# EasyEDA Pro project ProDoc_Integrated Board_2026-04-06FINAL.epro, board IC Mounted board
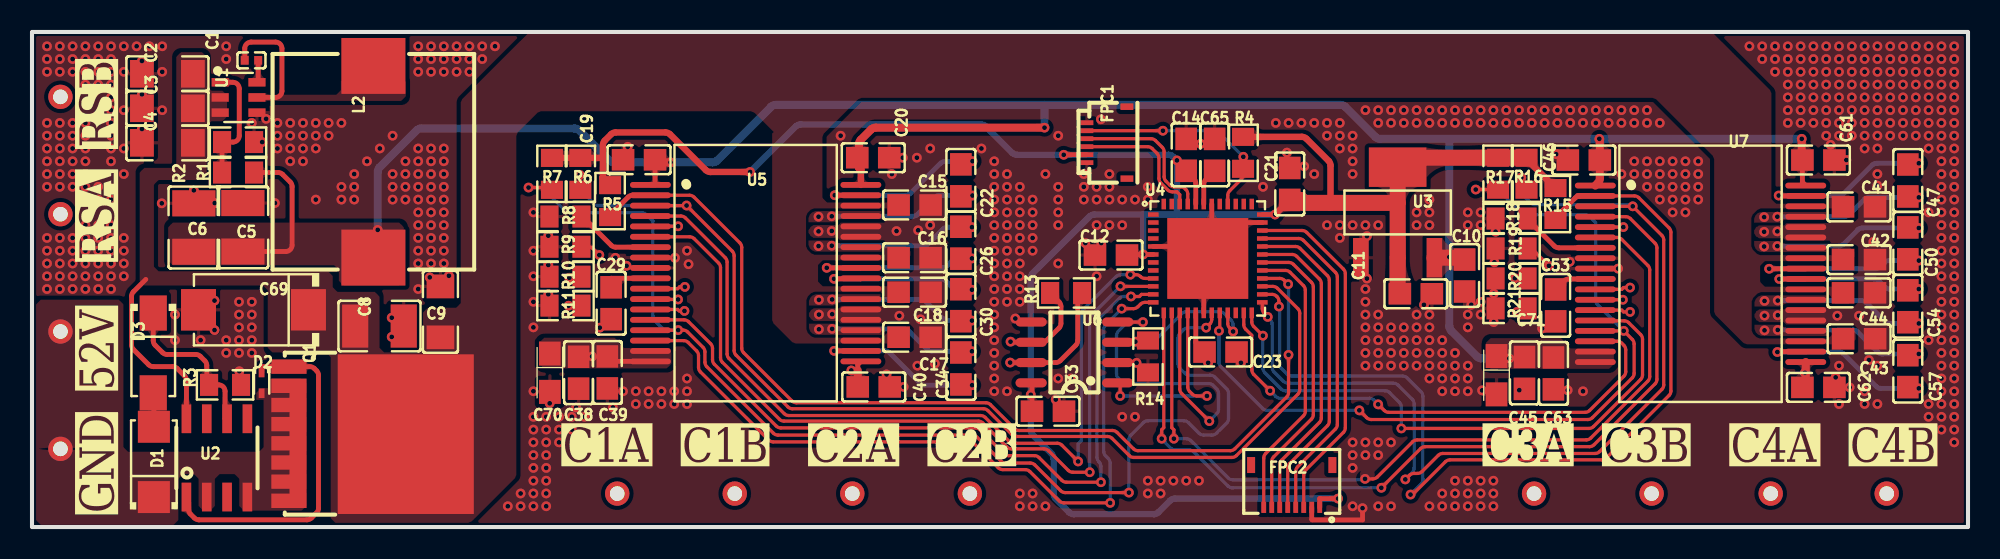
[diagram p1: board, top side]
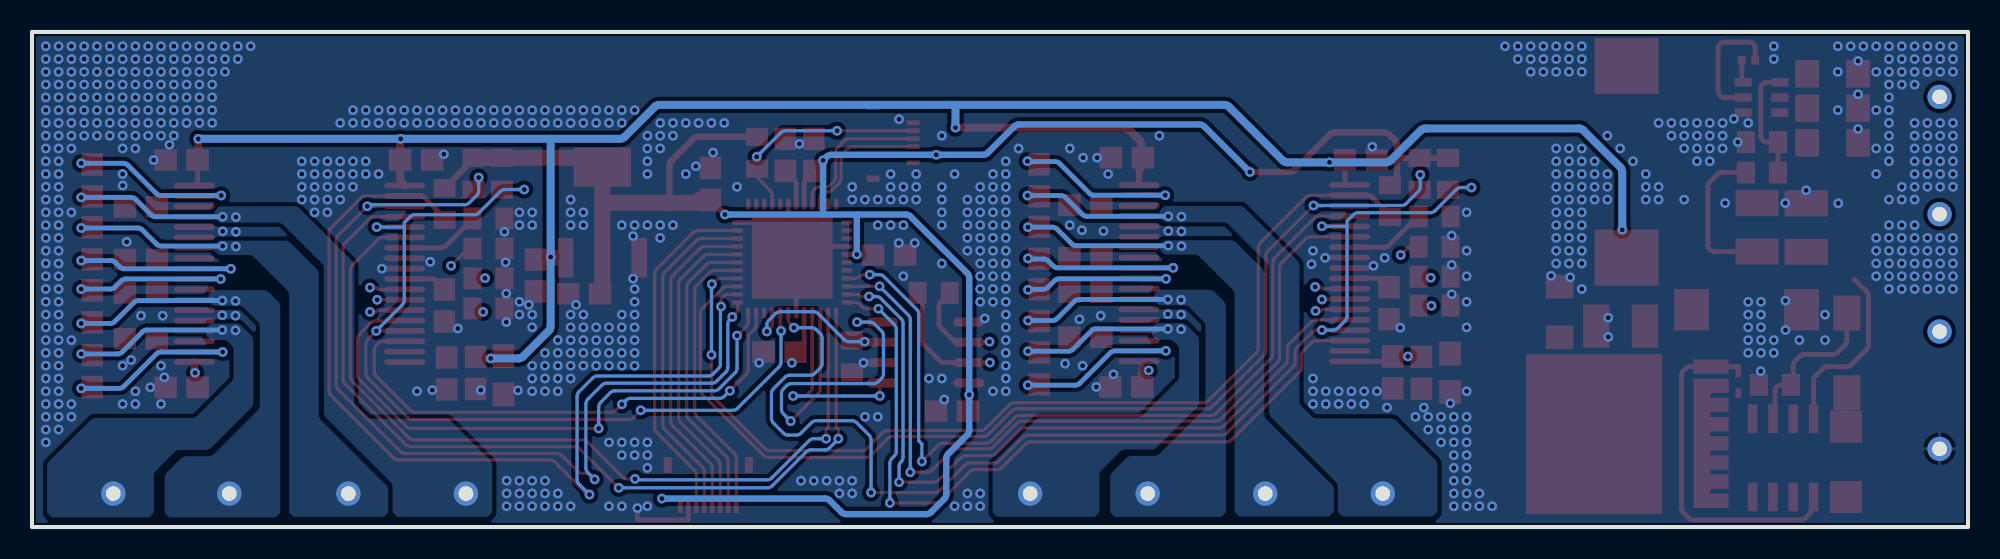
[diagram p2: board, bottom side, seen from below]

Outline 121 x 31 mm; copper layers: Top Layer, GND1, PWR (20VB/12VB), Bottom Layer. Coordinates in mm from the lower left corner of the outline.
Outline path: rectangle 0,31 121,0
Stack: Top Layer 0.035mm Outer layer thickness 1oz / Dielectric1 0.2104mm 7628 RC49% 8.6mil / GND1 0.0152mm Inner layer thickness / Dielectric2 1.065mm 1.1mm H/HOZ Copper / PWR (20VB/12VB) 0.0152mm Inner layer thickness / Dielectric3 0.2104mm 7628 RC49% 8.6mil / Bottom Layer 0.035mm Outer layer thickness 1oz

## Design rules (mm)
template: Custom Config
spacing copperThickness1oz (default): track to track 0.102, other pairs 0.152 to 0.3
spacing copperThickness2oz: track to track 0.203, other pairs 0.152 to 0.3
track width copperThickness1oz (default): min 0.203, default 0.203, max 2.54
track width copperThickness2oz: min 0.203, default 0.203, max 2.54
differential pair differentialPair (default): width min 0.127, default 0.254, max 2.54; gap min 0.152, default 0.152
via viaSize (default): diameter min 0.5, default 0.61, max 10; hole min 0.3, default 0.305, max 6.3

## Placement (name value [footprint] x y rotation side)
C1  100nF  [C0402]  13.72 29.22 180 top
C2  1uF  [C1206]  8.46 28.38 0 top
C3  1uF  [C1206]  8.46 26.22 0 top
C4  1uF  [C1206]  8.46 24.06 0 top
C5  10uF  [C1210]  13.18 18.77 270 top
C6  10uF  [C1210]  10.12 18.75 270 top
C8  4.7uF  [C1210]  21.72 12.58 180 top
C9  100nF  [C1206]  25.53 13.47 270 top
C10  10uF  [C0805]  89.54 15.75 90 top
C11  10uF  [C0805]  86.49 14.61 180 top
C12  100nF  [C0805]  67.44 17.03 0 top
C14  100nF  [C0805]  72.14 23.3 270 top
C15  100nF  [C0805]  55.16 20.17 180 top
C16  100nF  [C0805]  55.16 16.86 180 top
C17  100nF  [C0805]  55.16 11.89 180 top
C18  100nF  [C0805]  55.16 14.7 180 top
C19  100nF  [C0805]  37.94 23 0 top
C20  100nF  [C0805]  52.58 23.13 180 top
C21  100nF  [C0805]  78.61 21.48 270 top
C22  100nF  [C0805]  58.06 21.71 90 top
C23  100nF  [C0805]  74.28 10.96 180 top
C26  100nF  [C0805]  58.06 17.8 90 top
C29  100nF  [C0805]  36.2 14.01 270 top
C30  100nF  [C0805]  58.06 13.89 90 top
C33  100nF  [C0805]  63.5 7.25 180 top
C34  100nF  [C0805]  58.06 9.93 90 top
C38  100nF  [C0805]  34.16 9.66 90 top
C39  100nF  [C0805]  35.96 9.68 90 top
C40  100nF  [C0805]  52.61 8.77 180 top
C41  100nF  [C0805]  114.19 20.05 180 top
C42  100nF  [C0805]  114.19 16.75 180 top
C43  100nF  [C0805]  114.19 11.79 180 top
C44  100nF  [C0805]  114.19 14.66 180 top
C45  100nF  [C0805]  93.28 9.65 90 top
C46  100nF  [C0805]  96.99 22.98 0 top
C47  100nF  [C0805]  117.24 21.7 90 top
C50  100nF  [C0805]  117.24 17.76 90 top
C53  100nF  [C0805]  95.23 13.88 270 top
C54  100nF  [C0805]  117.24 13.83 90 top
C57  100nF  [C0805]  117.24 9.76 90 top
C61  100nF  [C0805]  111.65 22.98 180 top
C62  100nF  [C0805]  111.65 8.75 180 top
C63  100nF  [C0805]  95.09 9.62 90 top
C65  1uF  [C0805]  73.91 23.3 270 top
C69  22uF  [CAP-SMD_L7.3-W4.3-FD]  13.84 13.6 180 top
C70  4.7uF  [CASE-A_3216]  32.37 9.66 270 top
C71  4.7uF  [CASE-A_3216]  91.53 9.51 270 top
D1  SMAT70A-13-F  [SMA_L4.3-W2.6-LS5.2-RD]  7.62 4.08 90 top
D2  DDZ9699T-7  [SOD-523_L1.2-W0.8-LS1.6-RD]  14.35 9.03 270 top
D3  SMAJ24A  [SMA-SMD_L4.4-W2.7-LS5.4-RD]  7.58 10.9 270 top
FPC1  HC-FPC-05-09-6RLTAG  [FPC-SMD_6P-P0.50_HC-FPC-05-09-6RLTAG]  67.18 24.07 270 top
FPC2  5034800800  [FPC-SMD_5034800800]  78.73 2.56 180 top
L2  22uH  [IND-SMD_L13.5-W12.6]  21.34 22.87 270 top
NOREF  -  [Pad_e15]  1.78 4.9 0 top
NOREF#2  -  [Pad_e12]  1.78 26.94 0 top
NOREF#3  -  [Pad_e24]  93.88 2.09 90 top
NOREF#4  -  [Pad_e27]  115.92 2.09 90 top
NOREF#5  -  [Pad_e13]  1.78 19.59 0 top
NOREF#6  -  [Pad_e14]  1.78 12.24 0 top
NOREF#7  -  [Pad_e23]  58.62 2.09 90 top
NOREF#8  -  [Pad_e26]  108.67 2.09 90 top
NOREF#9  -  [Pad_e25]  101.23 2.09 90 top
NOREF#10  -  [Pad_e20]  36.58 2.09 90 top
NOREF#11  -  [Pad_e22]  51.27 2.09 90 top
NOREF#12  -  [Pad_e21]  43.92 2.09 90 top
Q1  XRS200N15TL  [TOLL-8_L10.4-W9.9-P1.20-LS11.7-BL_2]  19.71 7.64 270 top
R1  100kΩ  [R0805]  12.88 22.2 0 top
R2  7.15kΩ  [R0805]  12.88 24.1 180 top
R3  1kΩ  [R0805]  12.07 8.9 0 top
R4  10kΩ  [R0805]  75.69 23.43 90 top
R5  10kΩ  [R0805]  36.13 20.41 270 top
R6  10kΩ  [R0805]  34.27 22.11 270 top
R7  10kΩ  [R0805]  32.5 22.11 270 top
R8  24kΩ  [R0805]  33.34 19.44 0 top
R9  10kΩ  [R0805]  33.34 17.55 0 top
R10  10kΩ  [R0805]  33.34 15.68 0 top
R11  10kΩ  [R0805]  33.34 13.87 0 top
R13  120Ω  [R0805]  64.63 14.66 0 top
R14  10kΩ  [R0805]  69.75 10.68 90 top
R15  10kΩ  [R0805]  95.22 20.23 270 top
R16  10kΩ  [R0805]  93.41 22.12 270 top
R17  10kΩ  [R0805]  91.63 22.12 270 top
R18  24kΩ  [R0805]  92.47 19.32 0 top
R19  10kΩ  [R0805]  92.47 17.44 0 top
R20  10kΩ  [R0805]  92.47 15.57 0 top
R21  10kΩ  [R0805]  92.47 13.69 0 top
U1  LMR51625YDDCR  [SOT-23-6_L2.9-W1.6-P0.95-LS2.8-BL]  12.91 26.9 270 top
U2  LTC4359HS8#PBF  [SO-8_L4.9-W3.9-P1.27-LS6.0-BL]  11.56 4.33 0 top
U3  LD1117AG-33-AA3-A-R  [SOT-223-4_L6.5-W3.5-P2.30-LS7.0-BR]  85.35 19.7 270 top
U4  ATSAMD21G18A-MU  [QFN-48_L7.0-W7.0-P0.50-TL-EP5.1]  73.49 16.82 0 top
U5  DRV8432DKDR  [HSSOP-36_L16.0-W11.0-P0.65-LS14.2-BL]  45.23 15.9 270 top
U6  SP3485EN-L/TR  [SOIC-8_L5.0-W4.0-P1.27-LS6.0-BL]  65.15 10.93 90 top
U7  DRV8432DKDR  [HSSOP-36_L16.0-W11.0-P0.65-LS14.2-BL]  104.28 15.86 270 top

## Footprints (pads in the part's own frame, mm; a bottom-side part is the same pattern mirrored in y, then rotated)
C0402
  rect 0.5x0.54 smd: 1(-0.42,0) 2(0.42,0)
C0805
  rect 1.41x1.35 smd: 1(-1,0) 2(1,0)
C1206
  rect 1.485x1.728 smd: 1(-1.593,0) 2(1.593,0)
C1210
  rect 1.635x2.7 smd: 1(-1.518,0) 2(1.518,0)
CAP-SMD_L7.3-W4.3-FD
  rect 2.185x2.592 smd: 1(-3.437,0) 2(3.437,0)
CASE-A_3216
  rect 1.5x1.359 smd: 1(-1.2,0) 2(1.2,0)
FPC-SMD_6P-P0.50_HC-FPC-05-09-6RLTAG
  rect 0.3x0.8 smd: 1(1.25,-1.25) 2(0.75,-1.25) 3(0.25,-1.25) 4(-0.25,-1.25) 5(-0.75,-1.25) 6(-1.25,-1.25)
  rect 0.4x0.8 smd: 7(-2.25,1.25) 8(2.25,1.25)
FPC-SMD_5034800800
  rect 0.3x0.7 smd: 1(-1.75,1.325) 2(-1.25,1.325) 3(-0.75,1.325) 4(-0.25,1.325) 5(0.25,1.325) 6(0.75,1.325) 7(1.25,1.325) 8(1.75,1.325)
  rect 0.5x1 smd: 9(2.54,-1.325) 10(-2.54,-1.325)
HSSOP-36_L16.0-W11.0-P0.65-LS14.2-BL
  oval 0.364x2.552 smd: 1(-5.525,-6.576) 2(-4.875,-6.576) 3(-4.225,-6.576) 4(-3.575,-6.576) 5(-2.925,-6.576) 6(-2.275,-6.576) 7(-1.625,-6.576) 8(-0.975,-6.576) 9(-0.325,-6.576) 10(0.325,-6.576) 11(0.975,-6.576) 12(1.625,-6.576) 13(2.275,-6.576) 14(2.925,-6.576) 15(3.575,-6.576) 16(4.225,-6.576) 17(4.875,-6.576) 18(5.525,-6.576) 19(5.525,6.576) 20(4.875,6.576) 21(4.225,6.576) 22(3.575,6.576) 23(2.925,6.576) 24(2.275,6.576) 25(1.625,6.576) 26(0.975,6.576) 27(0.325,6.576) 28(-0.325,6.576) 29(-0.975,6.576) 30(-1.625,6.576) 31(-2.275,6.576) 32(-2.925,6.576) 33(-3.575,6.576) 34(-4.225,6.576) 35(-4.875,6.576) 36(-5.525,6.576)
IND-SMD_L13.5-W12.6
  rect 3.5x4 smd: 1(-6,0) 2(6,0)
Pad_e12
  round 1.524 hole 0.914: 1(0,0)
Pad_e13
  round 1.524 hole 0.914: 2(0,0)
Pad_e14
  round 1.524 hole 0.914: 3(0,0)
Pad_e15
  round 1.524 hole 0.914: 4(0,0)
Pad_e20
  round 1.524 hole 0.914: 1(0,0)
Pad_e21
  round 1.524 hole 0.914: 2(0,0)
Pad_e22
  round 1.524 hole 0.914: 3(0,0)
Pad_e23
  round 1.524 hole 0.914: 4(0,0)
Pad_e24
  round 1.524 hole 0.914: 1(0,0)
Pad_e25
  round 1.524 hole 0.914: 2(0,0)
Pad_e26
  round 1.524 hole 0.914: 3(0,0)
Pad_e27
  round 1.524 hole 0.914: 4(0,0)
QFN-48_L7.0-W7.0-P0.50-TL-EP5.1
  rect 0.665x0.28 smd: 1(-3.408,2.75) 2(-3.408,2.25) 3(-3.408,1.75) 4(-3.408,1.25) 5(-3.408,0.75) 6(-3.408,0.25) 7(-3.408,-0.25) 8(-3.408,-0.75) 9(-3.408,-1.25) 10(-3.408,-1.75) 11(-3.408,-2.25) 12(-3.408,-2.75) 25(3.408,-2.75) 26(3.408,-2.25) 27(3.408,-1.75) 28(3.408,-1.25) 29(3.408,-0.75) 30(3.408,-0.25) 31(3.408,0.25) 32(3.408,0.75) 33(3.408,1.25) 34(3.408,1.75) 35(3.408,2.25) 36(3.408,2.75)
  rect 0.28x0.665 smd: 13(-2.75,-3.408) 14(-2.25,-3.408) 15(-1.75,-3.408) 16(-1.25,-3.408) 17(-0.75,-3.408) 18(-0.25,-3.408) 19(0.25,-3.408) 20(0.75,-3.408) 21(1.25,-3.408) 22(1.75,-3.408) 23(2.25,-3.408) 24(2.75,-3.408) 37(2.75,3.408) 38(2.25,3.408) 39(1.75,3.408) 40(1.25,3.408) 41(0.75,3.408) 42(0.25,3.408) 43(-0.25,3.408) 44(-0.75,3.408) 45(-1.25,3.408) 46(-1.75,3.408) 47(-2.25,3.408) 48(-2.75,3.408)
  rect 5.06x5.06 smd: 49(0,0)
R0805
  rect 1.133x1.377 smd: 1(-1,0) 2(1,0)
SMA-SMD_L4.4-W2.7-LS5.4-RD
  rect 2.2x1.7 smd: 1(-2.5,0) 2(2.5,0)
SMA_L4.3-W2.6-LS5.2-RD
  rect 2x2 smd: 1(-2.2,0) 2(2.2,0)
SO-8_L4.9-W3.9-P1.27-LS6.0-BL
  rect 0.6x1.8 smd: 1(-1.905,-2.45) 2(-0.635,-2.45) 3(0.635,-2.45) 4(1.905,-2.45) 5(1.905,2.45) 6(0.635,2.45) 7(-0.635,2.45) 8(-1.905,2.45)
SOD-523_L1.2-W0.8-LS1.6-RD
  rect 0.6x0.36 smd: 1(-0.65,0) 2(0.65,0)
SOIC-8_L5.0-W4.0-P1.27-LS6.0-BL
  oval 0.569x1.95 smd: 1(-1.905,-2.705) 2(-0.635,-2.705) 3(0.635,-2.705) 4(1.905,-2.705) 5(1.905,2.705) 6(0.635,2.705) 7(-0.635,2.705) 8(-1.905,2.705)
SOT-23-6_L2.9-W1.6-P0.95-LS2.8-BL
  rect 0.532x1.072 smd: 1(-0.95,-1.149) 2(0,-1.149) 3(0.95,-1.149) 4(0.95,1.149) 5(0,1.149) 6(-0.95,1.149)
SOT-223-4_L6.5-W3.5-P2.30-LS7.0-BR
  rect 2.47x0.98 smd: 1(2.835,-2.3) 2(2.835,0) 3(2.835,2.3)
  rect 2.47x3.6 smd: 4(-2.835,0)
TOLL-8_L10.4-W9.9-P1.20-LS11.7-BL_2
  rect 0.9x2.2 smd: 1(-2.4,-3.65)
  custom 8.1x2.2 smd: 2(2.4,-3.65)
  rect 10x8.5 smd: 3(1.825,3.65)

## Nets
As in the schematic, except:
+52V: D1.1 D2.2 NOREF#6.3 Q1.2 U2.2 U2.4
GND: C2.1 C3.1 C4.1 C5.1 C6.1 C8.1 C9.1 C10.1 C11.1 C12.1 C14.1 C15.1 C16.1 C17.1 C18.1 C19.1 C20.1 C21.1 C23.1 C29.2 C33.1 C38.1 C39.1 C40.1 C41.1 C42.1 C43.1 C44.1 C45.1 C46.1 C53.2 C61.1 C62.1 C63.1 C65.1 C69.2 C70.2 C71.2 FPC1.1 FPC1.6 FPC2.2 NOREF.4 R2.1 R3.2 R8.1 R9.1 R10.1 R11.1 R14.1 R18.1 R19.1 R20.1 R21.1 U1.4 U3.1 U4.5 U4.18 U4.35 U4.42 U4.49 U5.8 U5.9 U5.23 U5.24 U5.31 U5.32 U6.2 U6.5 U7.8 U7.9 U7.23 U7.24 U7.31 U7.32
COIL1_A: C22.1 NOREF#10.1 U5.33
COIL1_B: C26.2 NOREF#12.2 U5.30
COIL2_A: C30.1 NOREF#11.3 U5.25
COIL2_B: C34.2 NOREF#7.4 U5.22
COIL3_A: C47.1 NOREF#3.1 U7.33
COIL3_B: C50.2 NOREF#9.2 U7.30
COIL4_A: C54.1 NOREF#8.3 U7.25
COIL4_B: C57.2 NOREF#4.4 U7.22
RS485_A: NOREF#5.2 R13.1 U6.6
RS485_B: NOREF#2.1 R13.2 U6.7

Pads without a net: FPC1 7 8; FPC2 9 10; U2 3 5 7; U4 1 2 3 4 7 8 22 37 38 39 41 47 48

## Via types
v1: diameter 0.61, hole 0.305, Top Layer to Bottom Layer, 883 vias

## Routing (per net, layer and track width the routed paths; a pad name or vN(x,y) marks a point on that pad's centre or on a via; arc(x,y) is an arc through that point)
+3V3B: length 163.8
  Top Layer w0.3: v1(81.63,1.78) 80.48,1.78 80.48,1.23 ; U4.17 72.74,11.67 arc(72.77,11.52) 72.85,11.39 C23.2 ; v1(64.48,23.31) 64.49,23.32 FPC1.2 ; 62.45,9.03 62.5,8.97 C33.2 ; C14.2 72.62,21.82 arc(72.71,21.69) 72.74,21.54 U4.44 ; U4.36 77.53,19.57 arc(77.68,19.6) 77.81,19.68 ; U4.6 v1(69.45,17.07) 68.47,17.07 C12.2
  Top Layer w0.305: 35.87,21.66 36.2,21.33
  Top Layer w0.4: R7.1 R6.1 35.68,23.11 ; R4.2 79.37,24.43 arc(79.52,24.4) 79.65,24.31 81.04,22.92 arc(81.13,22.8) 81.16,22.64 81.16,20.3 ; R15.1 93.11,23.33 ; 35.68,23.11 35.68,21.84 35.87,21.66 ; 35.68,23.11 35.68,23.92 arc(35.71,24.07) 35.8,24.2 36.19,24.59 arc(36.32,24.68) 36.47,24.71 39.59,24.71 arc(39.75,24.68) 39.88,24.59 42.12,22.35 arc(42.25,22.26) 42.4,22.23 v1(44.88,22.23) ; 77.81,19.68 78.49,20.37 arc(78.62,20.45) 78.77,20.48
  Top Layer w1: 78.77,20.48 79.28,20.48 79.47,20.3 85.35,20.3 ; C11.2 85.35,14.74 U3.2 85.35,20.3 ; 85.35,20.3 85.35,22.72 arc(85.47,23.01) 85.75,23.12 R17.1 92.91,23.12
  PWR (20VB/12VB) w0.4: v1(81.63,1.78) 76.82,1.78 arc(76.67,1.81) 76.54,1.9 75.23,3.22 arc(75.14,3.35) 75.11,3.5 75.11,8.52 arc(75.08,8.67) 74.99,8.8 v1(73.51,10.28)
  Bottom Layer w0.4: 69.45,19.57 71.56,19.57 ; 69.45,19.57 66.38,19.57 arc(66.23,19.54) 66.1,19.45 62.54,15.89 arc(62.45,15.76) 62.42,15.61 v1(62.42,8.28) 62.42,6.06 arc(62.45,5.91) 62.54,5.78 63.74,4.58 arc(63.83,4.45) 63.86,4.29 63.86,2.05 arc(63.89,1.9) 63.98,1.77 64.82,0.92 arc(64.95,0.84) 65.1,0.81 70.12,0.81 arc(70.27,0.84) 70.4,0.92 71.14,1.67 arc(71.27,1.75) 71.42,1.78 v1(81.63,1.78) ; 69.45,19.57 v1(69.45,17.07) ; 71.56,19.57 71.56,22.79 arc(71.53,22.95) 71.44,23.08 71.33,23.19 arc(71.2,23.28) 71.04,23.31 v1(64.48,23.31) 61.55,23.31 arc(61.4,23.34) 61.27,23.42 59.6,25.09 arc(59.47,25.18) 59.32,25.21 48.02,25.21 arc(47.87,25.18) 47.74,25.09 v1(44.88,22.23) ; 71.56,19.57 v1(77.69,19.57)
  vias: v1(71.56,22.96)
+12VB: length 206.6
  Top Layer w0.305: 13.18,17.25 15.86,17.25 arc(16.14,17.37) 16.26,17.65 16.26,21.32 arc(16.23,21.47) 16.14,21.6 15.66,22.08 arc(15.53,22.17) 15.38,22.2 R1.2 ; C61.2 110.65,21.59 U7.36 ; v1(51.21,9.81) 51.61,9.81 51.61,10.18 51.8,10.37 ; U5.1 38.94,21.42 C19.2 ; C39.2 36.15,10.49 arc(36.28,10.4) 36.43,10.37 U5.18
  Top Layer w0.4: 51.68,23.02 C20.2 ; 51.8,22.39 51.8,21.42
  Top Layer w0.5: v1(63.28,25.01) 52.72,25.01 arc(52.57,24.98) 52.44,24.89 51.8,24.25 arc(51.71,24.12) 51.68,23.97 51.68,22.51 51.8,22.39 ; v1(110.61,24.31) 110.61,23.02 C61.2 ; U7.19 110.86,8.96 C62.2 ; C40.2 51.61,9.81 ; C19.2 39.11,22.83 v1(39.91,22.83) ; U7.1 97.87,21.55 arc(97.96,21.68) 97.99,21.83 C46.2 97.99,24.28 v1(97.96,24.31)
  Top Layer w1: U3.3 89.43,16.86 C10.2
  PWR (20VB/12VB) w0.5: v1(110.81,9.66) 110.81,24.11 v1(110.61,24.31) ; v1(51.21,9.81) 44.38,9.81 arc(44.22,9.84) 44.09,9.92 43.45,10.57 arc(43.32,10.65) 43.17,10.68 v1(35.01,10.68) 26.52,10.68 arc(26.37,10.71) 26.24,10.8 21.73,15.32 arc(21.64,15.45) 21.61,15.6 v1(21.61,18.61)
  Bottom Layer w0.5: 63.28,26.43 81.79,26.43 arc(81.95,26.4) 82.08,26.32 83.97,24.42 arc(84.1,24.34) 84.25,24.31 88.58,24.31 ; 63.28,26.43 v1(63.28,25.01) ; 63.28,26.43 46.47,26.43 arc(46.32,26.4) 46.19,26.32 42.83,22.95 arc(42.7,22.86) 42.54,22.83 v1(39.91,22.83) 36.37,22.83 arc(36.22,22.86) 36.09,22.95 34.2,24.84 arc(34.07,24.93) 33.92,24.96 24.32,24.96 arc(24.17,24.93) 24.04,24.84 21.73,22.52 arc(21.64,22.4) 21.61,22.24 v1(21.61,18.61) ; 88.58,24.31 v1(88.58,16.91) 88.58,12.57 arc(88.61,12.42) 88.7,12.29 90.32,10.67 arc(90.45,10.59) 90.6,10.56 v1(92.33,10.56) ; 88.58,24.31 v1(97.96,24.31) v1(110.61,24.31)
+52VB: length 11.3
  Top Layer w0.305: U2.8 9.65,9.18 arc(9.62,9.34) 9.54,9.47 9.07,9.93 arc(8.94,10.01) 8.79,10.05 7.58,10.05 arc(7.42,10.08) 7.29,10.16 6.34,11.11 arc(6.25,11.24) 6.22,11.4 6.22,14.45 arc(6.25,14.6) 6.34,14.73 7.11,15.51
GND: length 20.6
  Top Layer w0.3: U4.49 73.35,16.68 arc(73.27,16.55) 73.24,16.4 U4.18 ; U4.49 72.85,17.45 arc(72.72,17.54) 72.57,17.57 U4.5 ; U4.49 73.49,18.27 arc(73.52,18.42) 73.6,18.55 73.74,18.69 ; U4.49 73.62,16.95 arc(73.71,17.08) 73.74,17.23 73.74,18.69 ; 73.74,18.69 74,18.95 arc(74.13,19.04) 74.28,19.07 U4.35 ; 73.74,18.69 U4.42 ; v1(83.16,1.18) 83.16,0.45 80.02,0.45 79.98,0.48 79.98,1.23
  vias: v1(0.94,30.1) v1(0.94,29.3) v1(0.94,28.5) v1(0.94,25.3) v1(0.94,24.5) v1(0.94,23.7) v1(0.94,22.9) v1(0.94,22.1) v1(0.94,21.3) v1(0.94,18.1) v1(0.94,17.3) v1(0.94,16.5) v1(0.94,15.7) v1(0.94,14.9) v1(1.74,30.1) v1(1.74,29.3) v1(1.74,28.5) v1(1.74,25.3) v1(1.74,24.5) v1(1.74,23.7) v1(1.74,22.9) v1(1.74,22.1) v1(1.74,21.3) v1(1.74,18.1) v1(1.74,17.3) v1(1.74,16.5) v1(1.74,15.7) v1(1.74,14.9) v1(2.54,30.1) v1(2.54,29.3) v1(2.54,28.5) v1(2.54,25.3) v1(2.54,24.5) v1(2.54,23.7) v1(2.54,22.9) v1(2.54,22.1) v1(2.54,21.3) v1(2.54,18.1) v1(2.54,17.3) v1(2.54,16.5) v1(2.54,15.7) v1(2.54,14.9) v1(3.34,30.1) v1(3.34,29.3) v1(3.34,28.5) v1(3.34,27.7) v1(3.34,25.3) v1(3.34,24.5) v1(3.34,23.7) v1(3.34,22.9) v1(3.34,22.1) v1(3.34,21.3) v1(3.34,20.5) v1(3.34,18.9) v1(3.34,18.1) v1(3.34,17.3) v1(3.34,16.5) v1(3.34,15.7) v1(3.34,14.9) v1(4.14,30.1) v1(4.14,29.3) v1(4.14,28.5) v1(4.14,27.7) v1(4.14,21.3) v1(4.14,20.5) v1(4.14,18.9) v1(4.14,18.1) v1(4.14,17.3) v1(4.14,16.5) v1(4.14,15.7) v1(4.14,14.9) v1(4.94,30.1) v1(4.94,29.3) v1(4.94,28.5) v1(4.94,27.7) v1(4.94,26.9) v1(4.94,26.1) v1(4.94,25.3) v1(4.94,24.5) v1(4.94,23.7) v1(4.94,22.9) v1(4.94,20.5) v1(4.94,18.9) v1(4.94,18.1) v1(4.94,17.3) v1(4.94,16.5) v1(4.94,15.7) v1(4.94,14.9) v1(5.74,30.1) v1(5.74,28.5) v1(5.74,26.1) v1(5.74,23.7) v1(5.74,22.1) v1(5.74,18.1) v1(5.74,17.3) v1(5.74,16.5) v1(5.74,15.7) v1(6.54,30.1) v1(6.87,29.18) v1(6.87,27.09) v1(6.87,24.92) v1(7.34,30.1) v1(8.11,20.27) v1(8.14,30.1) v1(8.14,28.5) v1(8.14,26.1) v1(8.94,13.3) v1(8.94,11.7) v1(10.12,21.08) v1(10.54,11.7) v1(11.42,20.29) v1(11.41,14.18) v1(11.41,12.33) v1(12.14,30.1) v1(12.14,29.3) v1(12.14,11.7) v1(12.14,10.9) v1(12.94,14.1) v1(12.94,13.3) v1(12.94,12.5) v1(12.94,11.7) v1(12.94,10.9) v1(12.96,9.76) v1(13.74,25.3) v1(13.74,14.1) v1(13.74,13.3) v1(13.74,12.5) v1(13.74,11.7) v1(13.74,10.9) v1(14.39,24.1) v1(14.63,25.56) v1(15.18,20.29) v1(15.34,25.3) v1(15.34,24.5) v1(15.34,23.7) v1(16.14,25.3) v1(16.14,24.5) v1(16.14,23.7) v1(16.14,22.9) v1(16.94,25.3) v1(16.94,24.5) v1(16.94,23.7) v1(16.94,22.9) v1(17.74,25.3) v1(17.74,24.5) v1(17.74,23.7) v1(17.74,20.5) v1(18.54,25.3) v1(18.54,24.5) v1(19.34,25.3) v1(19.34,21.3) v1(19.34,20.5) v1(20.14,22.1) v1(20.14,21.3) v1(20.14,20.5) v1(20.94,22.9) v1(21.74,23.7) v1(22.48,13.11) v1(22.48,11.91) v1(22.54,24.5) v1(22.54,22.1) v1(22.54,21.3) v1(22.54,20.5) v1(23.34,22.9) v1(23.34,22.1) v1(23.34,21.3) v1(23.34,20.5) v1(24.14,30.1) v1(24.14,29.3) v1(24.14,28.5) v1(24.14,23.7) v1(24.14,22.9) v1(24.14,22.1) v1(24.14,21.3) v1(24.14,20.5) v1(24.14,19.7) v1(24.14,18.9) v1(24.14,18.1) v1(24.14,17.3) v1(24.14,16.5) v1(24.14,14.9) v1(24.86,15.63) v1(24.94,30.1) v1(24.94,29.3) v1(24.94,28.5) v1(24.94,23.7) v1(24.94,22.9) v1(24.94,22.1) v1(24.94,21.3) v1(24.94,20.5) v1(24.94,19.7) v1(24.94,18.9) v1(24.94,18.1) v1(24.94,17.3) v1(24.94,16.5) v1(25.74,30.1) v1(25.74,29.3) v1(25.74,28.5) v1(25.74,23.7) v1(25.74,22.9) v1(25.74,22.1) v1(25.74,21.3) v1(25.74,20.5) v1(25.74,19.7) v1(25.74,18.9) v1(25.74,18.1) v1(25.74,17.3) v1(25.74,16.5) v1(26.06,15.73) v1(26.54,30.1) v1(26.54,29.3) v1(26.54,28.5) v1(27.34,30.1) v1(27.34,29.3) v1(27.34,28.5) v1(28.14,30.1) v1(28.14,29.3) v1(28.94,30.1) v1(29.74,1.3) v1(30.54,2.1) v1(30.54,1.3) v1(31.34,19.7) v1(31.34,17.3) v1(31.34,15.7) v1(31.34,14.1) v1(31.34,12.5) v1(31.34,8.5) v1(31.34,6.9) v1(31.34,6.1) v1(31.34,5.3) v1(31.34,4.5) v1(31.34,3.7) v1(31.34,2.9) v1(31.34,2.1) v1(31.34,1.3) v1(32.14,6.9) v1(32.14,6.1) v1(32.14,5.3) v1(32.14,4.5) v1(32.14,3.7) v1(32.14,2.9) v1(32.14,2.1) v1(32.14,1.3) v1(32.27,18.25) v1(32.27,16.41) v1(32.27,14.58) v1(32.36,7.75) v1(32.94,6.9) v1(32.94,6.1) v1(32.94,5.3) v1(33.74,6.9) v1(33.74,6.1) v1(34.01,7.48) v1(34.54,6.9) v1(35.48,12.48) v1(36.31,7.48) v1(36.46,16.86) v1(36.94,8.5) v1(37.16,16.36) v1(37.23,23.81) v1(37.74,8.5) v1(37.74,7.7) v1(38.54,8.5) v1(38.54,7.7) v1(39.34,8.5) v1(39.34,7.7) v1(40.18,16.86) v1(40.14,8.5) v1(40.14,7.7) v1(40.94,17.3) v1(41.03,16.46) v1(40.94,9.3) v1(40.94,8.5) v1(40.94,7.7) v1(49.16,18.51) v1(49.18,13.3) v1(49.98,18.54) v1(50.01,13.33) v1(50.54,24.5) v1(53.41,9.56) v1(53.74,22.1) v1(54.03,18.53) v1(54.21,13.23) v1(54.43,23.13) v1(54.48,8.77) v1(55.3,23.13) v1(55.38,18.58) v1(55.34,10.1) v1(55.53,13.01) v1(56.14,23.7) v1(56.14,18.9) v1(56.43,10.23) v1(59.34,23.7) v1(60.14,22.9) v1(60.14,22.1) v1(60.14,21.3) v1(60.14,20.5) v1(60.14,19.7) v1(60.14,18.9) v1(60.14,18.1) v1(60.14,17.3) v1(60.14,16.5) v1(60.14,15.7) v1(60.14,14.9) v1(60.14,14.1) v1(60.14,13.3) v1(60.14,12.5) v1(60.14,11.7) v1(60.14,10.9) v1(60.14,10.1) v1(60.14,9.3) v1(60.14,8.5) v1(60.94,22.1) v1(60.94,21.3) v1(60.94,20.5) v1(60.94,19.7) v1(60.94,18.9) v1(60.94,18.1) v1(60.94,17.3) v1(60.94,16.5) v1(60.94,15.7) v1(60.94,14.9) v1(60.94,14.1) v1(60.94,8.5) v1(61.46,13.06) v1(61.74,21.3) v1(61.74,20.5) v1(61.74,19.7) v1(61.74,18.9) v1(61.74,18.1) v1(61.74,17.3) v1(61.74,16.5) v1(61.74,15.7) v1(61.74,14.9) v1(61.74,14.1) v1(61.74,2.1) v1(61.74,1.3) v1(62.54,20.5) v1(62.54,19.7) v1(62.54,18.9) v1(62.54,18.1) v1(62.54,17.3) v1(62.54,2.1) v1(62.54,1.3) v1(63.34,22.1) v1(63.34,1.3) v1(63.98,7.98) v1(64.14,24.5) v1(64.14,21.3) v1(64.14,20.5) v1(64.14,19.7) v1(64.14,18.9) v1(64.14,16.5) v1(64.14,9.3) v1(64.94,9.3) v1(65.74,22.1) v1(65.74,21.3) v1(65.74,20.5) v1(65.83,17.78) v1(66.54,21.3) v1(66.54,20.5) v1(66.54,18.9) v1(66.54,15.7) v1(66.81,25.53) v1(66.83,17.78) v1(67.34,22.1) v1(67.34,21.3) v1(67.34,20.5) v1(67.34,18.9) v1(68.14,20.5) v1(68.14,18.9) v1(68.14,6.9) v1(68.94,20.5) v1(69.03,10.28) v1(68.94,6.9) v1(69.74,21.3) v1(69.74,20.5) v1(69.74,2.9) v1(69.74,2.1) v1(70.54,2.9) v1(70.54,2.1) v1(71.34,2.9) v1(72.14,2.9) v1(72.94,2.9) v1(73.04,23.99) v1(75.56,10.28) v1(76.94,21.3) v1(77.74,25.3) v1(78.43,23.45) v1(78.54,25.3) v1(79.34,25.3) v1(79.51,22.59) v1(80.14,25.3) v1(80.14,22.1) v1(80.94,25.3) v1(80.94,24.5) v1(80.94,18.9) v1(81.74,25.3) v1(81.74,24.5) v1(81.74,23.7) v1(81.74,18.9) v1(81.74,18.1) v1(82.54,24.5) v1(82.54,23.7) v1(82.54,22.9) v1(82.54,22.1) v1(82.54,18.9) v1(82.54,5.3) v1(82.54,4.5) v1(82.54,3.7) v1(82.54,1.3) v1(83.34,26.1) v1(83.34,18.9) v1(83.43,18.22) v1(83.43,15.56) v1(83.34,14.9) v1(83.34,14.1) v1(83.34,13.3) v1(83.34,12.5) v1(83.34,11.7) v1(83.34,10.9) v1(83.34,10.1) v1(83.34,5.3) v1(83.34,4.5) v1(84.14,26.1) v1(84.14,25.3) v1(84.14,18.9) v1(84.14,13.3) v1(84.14,12.5) v1(84.14,11.7) v1(84.14,10.9) v1(84.14,10.1) v1(84.14,5.3) v1(84.14,4.5) v1(84.14,1.3) v1(84.94,26.1) v1(84.94,25.3) v1(84.94,12.5) v1(84.94,11.7) v1(84.94,10.9) v1(84.94,10.1) v1(84.94,5.3) v1(84.94,1.3) v1(85.74,26.1) v1(85.74,25.3) v1(85.74,12.5) v1(85.74,11.7) v1(85.74,10.9) v1(85.74,10.1) v1(86.54,26.1) v1(86.54,25.3) v1(86.54,19.7) v1(86.54,18.9) v1(86.54,13.3) v1(86.54,12.5) v1(86.54,11.7) v1(86.54,10.9) v1(86.54,10.1) v1(87,13.92) v1(87.34,26.1) v1(87.34,25.3) v1(87.34,20.5) v1(87.34,19.7) v1(87.34,18.9) v1(87.34,13.3) v1(87.34,12.5) v1(87.34,11.7) v1(87.34,10.9) v1(87.34,10.1) v1(87.34,9.3) v1(87.34,1.3) v1(88.14,26.1) v1(88.14,25.3) v1(88.14,11.7) v1(88.14,10.9) v1(88.14,10.1) v1(88.14,9.3) v1(88.14,8.5) v1(88.14,2.1) v1(88.14,1.3) v1(88.94,26.1) v1(88.94,25.3) v1(88.94,10.9) v1(88.94,10.1) v1(88.94,9.3) v1(88.94,8.5) v1(88.94,2.9) v1(88.94,2.1) v1(88.94,1.3) v1(89.74,26.1) v1(89.74,25.3) v1(89.74,19.7) v1(89.74,18.9) v1(89.74,13.3) v1(89.74,12.5) v1(89.74,10.1) v1(89.74,9.3) v1(89.74,8.5) v1(89.74,2.9) v1(89.74,2.1) v1(89.74,1.3) v1(89.95,13.92) v1(90.54,26.1) v1(90.54,25.3) v1(90.54,19.7) v1(90.54,18.9) v1(90.54,14.1) v1(90.54,13.3) v1(90.63,8.56) v1(90.54,2.9) v1(90.54,2.1) v1(90.54,1.3) v1(91.34,26.1) v1(91.34,25.3) v1(91.4,16.58) v1(91.36,14.62) v1(91.36,12.83) v1(91.34,2.9) v1(91.34,2.1) v1(91.34,1.3) v1(91.47,18.49) v1(92.14,26.1) v1(92.14,25.3) v1(92.94,26.1) v1(92.94,25.3) v1(92.95,8.57) v1(93.74,26.1) v1(93.74,25.3) v1(94.38,12.43) v1(94.54,26.1) v1(94.54,25.3) v1(95.26,23.35) v1(95.34,26.1) v1(95.34,25.3) v1(95.98,8.57) v1(96.11,16.61) v1(96.14,26.1) v1(96.14,25.3) v1(96.94,26.1) v1(96.94,25.3) v1(96.94,8.5) v1(97.74,26.1) v1(97.74,25.3) v1(98.54,26.1) v1(98.54,25.3) v1(99.13,16.18) v1(99.34,26.1) v1(99.34,25.3) v1(99.34,22.1) v1(100.14,26.1) v1(100.14,25.3) v1(100.14,22.9) v1(100.14,22.1) v1(100.94,26.1) v1(100.94,25.3) v1(100.94,22.9) v1(100.94,22.1) v1(100.94,21.3) v1(101.74,25.3) v1(101.74,22.9) v1(101.74,22.1) v1(101.74,21.3) v1(101.74,20.5) v1(102.54,22.9) v1(102.54,22.1) v1(102.54,21.3) v1(102.54,20.5) v1(102.54,19.7) v1(103.34,22.9) v1(103.34,22.1) v1(103.34,21.3) v1(103.34,20.5) v1(103.34,19.7) v1(104.14,22.9) v1(104.14,22.1) v1(104.14,21.3) v1(104.14,20.5) v1(107.34,30.1) v1(108.14,30.1) v1(108.14,29.3) v1(108.26,18.49) v1(108.28,13.24) v1(108.94,30.1) v1(108.94,29.3) v1(108.94,28.5) v1(109.08,18.51) v1(109.11,13.26) v1(109.74,30.1) v1(109.74,29.3) v1(109.74,28.5) v1(109.74,27.7) v1(109.74,26.9) v1(109.74,26.1) v1(109.74,25.3) v1(110.54,30.1) v1(110.54,29.3) v1(110.54,28.5) v1(110.54,27.7) v1(110.54,26.9) v1(110.54,26.1) v1(110.54,25.3) v1(111.34,30.1) v1(111.34,29.3) v1(111.34,28.5) v1(111.34,27.7) v1(111.34,26.9) v1(111.34,26.1) v1(111.34,25.3) v1(112.14,30.1) v1(112.14,29.3) v1(112.14,28.5) v1(112.14,27.7) v1(112.14,26.9) v1(112.14,26.1) v1(112.14,25.3) v1(112.14,24.5) v1(112.41,23.93) v1(112.73,9.37) v1(112.83,13.23) v1(112.94,30.1) v1(112.94,29.3) v1(112.94,28.5) v1(112.94,27.7) v1(112.94,26.9) v1(112.94,26.1) v1(112.94,25.3) v1(112.94,24.5) v1(112.94,10.1) v1(112.94,7.7) v1(113.4,22.98) v1(113.6,8.75) v1(113.74,30.1) v1(113.74,29.3) v1(113.74,28.5) v1(113.74,27.7) v1(113.74,26.9) v1(113.74,26.1) v1(113.74,25.3) v1(113.74,24.5) v1(114.19,13.23) v1(114.54,30.1) v1(114.54,29.3) v1(114.54,28.5) v1(114.54,27.7) v1(114.54,26.9) v1(114.54,26.1) v1(114.54,25.3) v1(114.54,24.5) v1(114.54,23.7) v1(114.54,8.5) v1(114.54,7.7) v1(114.81,10.46) v1(115.08,17.86) v1(115.34,30.1) v1(115.34,29.3) v1(115.34,28.5) v1(115.34,27.7) v1(115.34,26.9) v1(115.34,26.1) v1(115.34,25.3) v1(115.34,24.5) v1(115.34,23.7) v1(115.34,22.1) v1(115.33,21.38) v1(115.34,10.1) v1(115.34,7.7) v1(116.14,30.1) v1(116.14,29.3) v1(116.14,28.5) v1(116.14,27.7) v1(116.14,26.9) v1(116.14,26.1) v1(116.14,25.3) v1(116.14,24.5) v1(116.94,30.1) v1(116.94,29.3) v1(116.94,28.5) v1(116.94,27.7) v1(116.94,26.9) v1(116.94,26.1) v1(116.94,25.3) v1(116.94,24.5) v1(117.74,30.1) v1(117.74,29.3) v1(117.74,28.5) v1(117.74,27.7) v1(117.74,26.9) v1(117.74,26.1) v1(117.74,25.3) v1(117.74,24.5) v1(118.54,30.1) v1(118.54,29.3) v1(118.54,28.5) v1(118.54,27.7) v1(118.54,26.9) v1(118.54,26.1) v1(118.54,25.3) v1(118.54,24.5) v1(118.54,23.7) v1(118.54,19.7) v1(118.54,11.7) v1(118.54,7.7) v1(118.54,6.9) v1(119.34,30.1) v1(119.34,29.3) v1(119.34,28.5) v1(119.34,27.7) v1(119.34,26.9) v1(119.34,26.1) v1(119.34,25.3) v1(119.34,24.5) v1(119.34,23.7) v1(119.34,22.9) v1(119.34,22.1) v1(119.34,21.3) v1(119.34,20.5) v1(119.34,19.7) v1(119.34,18.9) v1(119.34,18.1) v1(119.34,17.3) v1(119.34,16.5) v1(119.34,15.7) v1(119.34,14.9) v1(119.34,14.1) v1(119.34,13.3) v1(119.34,12.5) v1(119.34,11.7) v1(119.34,10.9) v1(119.34,10.1) v1(119.34,9.3) v1(119.34,8.5) v1(119.34,7.7) v1(119.34,6.9) v1(119.34,6.1) v1(120.14,30.1) v1(120.14,29.3) v1(120.14,28.5) v1(120.14,27.7) v1(120.14,26.9) v1(120.14,26.1) v1(120.14,25.3) v1(120.14,24.5) v1(120.14,23.7) v1(120.14,22.9) v1(120.14,22.1) v1(120.14,21.3) v1(120.14,20.5) v1(120.14,19.7) v1(120.14,18.9) v1(120.14,18.1) v1(120.14,17.3) v1(120.14,16.5) v1(120.14,15.7) v1(120.14,14.9) v1(120.14,14.1) v1(120.14,13.3) v1(120.14,12.5) v1(120.14,11.7) v1(120.14,10.9) v1(120.14,10.1) v1(120.14,9.3) v1(120.14,8.5) v1(120.14,7.7) v1(120.14,6.9) v1(120.14,6.1) v1(120.14,5.3)
2: length 10
  Top Layer w0.203: U5.11 40.36,14.92 40.47,15.04 v1(40.8,15.04) ; v1(35.46,17.03) 35.06,17.43 arc(34.93,17.52) 34.78,17.55 R9.2
  PWR (20VB/12VB) w0.203: v1(35.46,17.03) 35.46,16.52 arc(35.49,16.37) 35.58,16.24 36.66,15.15 arc(36.79,15.07) 36.95,15.04 v1(40.8,15.04)
3: length 9.8
  Top Layer w0.203: U5.12 38.68,14.25 v1(40.38,14.25) ; v1(33.58,15.61) 34.27,15.61 R10.2
  PWR (20VB/12VB) w0.203: v1(40.38,14.25) 36.61,14.25 arc(36.45,14.28) 36.32,14.37 35.2,15.49 arc(35.07,15.58) 34.92,15.61 v1(33.58,15.61)
4: length 10.3
  Top Layer w0.203: U5.13 40.36,13.62 40.45,13.53 v1(40.78,13.53) ; v1(33.53,13.86) 33.54,13.87 R11.2
  PWR (20VB/12VB) w0.203: v1(33.53,13.86) 33.94,13.86 arc(34.1,13.83) 34.23,13.74 34.32,13.65 arc(34.45,13.56) 34.6,13.53 v1(40.78,13.53)
7: length 9.8
  Top Layer w0.203: R19.2 93.72,17.44 v1(94.81,16.36) ; v1(99.88,14.99) 99.47,14.99 99.36,14.88 U7.11
  PWR (20VB/12VB) w0.203: v1(99.88,14.99) 96.01,14.99 arc(95.86,15.03) 95.73,15.11 94.81,16.03 v1(94.81,16.36)
8: length 9.8
  Top Layer w0.203: U7.12 v1(99.43,14.23) ; v1(92.68,15.58) 93.46,15.58 R20.2
  PWR (20VB/12VB) w0.203: v1(99.43,14.23) 95.2,14.23 arc(95.05,14.26) 94.92,14.35 93.8,15.47 arc(93.67,15.55) 93.52,15.58 v1(92.68,15.58)
9: length 10
  Top Layer w0.203: v1(99.88,13.47) 99.47,13.47 99.36,13.58 U7.13 ; R21.2 93.25,13.47 v1(92.81,13.47)
  PWR (20VB/12VB) w0.203: v1(99.88,13.47) v1(92.81,13.47)
BST1: length 11.1
  Top Layer w0.305: 51.8,20.77 50.17,20.77
  Bottom Layer w0.305: v1(58.78,22.91) 58.78,22.88 57.06,22.88 arc(56.9,22.85) 56.77,22.77 54.9,20.89 arc(54.77,20.81) 54.62,20.78 v1(50.17,20.78)
BST2: length 11.4
  Top Layer w0.305: v1(49.67,16.23) 51.8,16.23 51.8,16.22
  Bottom Layer w0.305: v1(49.67,16.23) 56.89,16.23 arc(57.04,16.26) 57.17,16.35 57.49,16.67 arc(57.62,16.75) 57.77,16.78 58.75,16.78 v1(58.75,16.82)
BST3: length 10.6
  Top Layer w0.305: v1(50.13,15.54) 51.77,15.54 51.8,15.57
  Bottom Layer w0.305: v1(50.13,15.54) 56.81,15.54 arc(56.96,15.51) 57.09,15.42 57.52,15 arc(57.65,14.91) 57.8,14.88 58.75,14.88 v1(58.75,14.86)
BST4: length 11.2
  Top Layer w0.305: 51.8,11.02 51.8,11.03 v1(50.13,11.03)
  Bottom Layer w0.305: v1(50.13,11.03) 53.32,11.03 arc(53.47,11) 53.6,10.92 55.52,9 arc(55.65,8.91) 55.8,8.88 v1(58.76,8.88)
BST5: length 11.3
  Top Layer w0.305: U7.35 109.19,20.73 v1(109.17,20.76)
  Bottom Layer w0.305: v1(109.17,20.76) 112.94,20.76 arc(113.1,20.79) 113.23,20.88 115.01,22.66 arc(115.14,22.75) 115.29,22.78 v1(117.93,22.78)
BST6: length 11.8
  Top Layer w0.305: U7.28 110.85,16.17 v1(108.57,16.17)
  Bottom Layer w0.305: v1(108.57,16.17) 115.23,16.17 arc(115.38,16.2) 115.51,16.29 115.79,16.57 arc(115.92,16.65) 116.08,16.69 v1(117.93,16.69)
BST7: length 10.6
  Top Layer w0.305: v1(109.2,15.53) 110.86,15.53
  Bottom Layer w0.305: v1(117.93,14.9) 116.1,14.9 arc(115.95,14.93) 115.82,15.02 115.42,15.42 arc(115.3,15.5) 115.14,15.53 v1(109.2,15.53)
BST8: length 11.5
  Top Layer w0.305: U7.20 109.11,10.98 v1(109.08,10.96)
  Bottom Layer w0.305: v1(117.93,8.68) 115.55,8.68 arc(115.39,8.71) 115.26,8.8 113.22,10.84 arc(113.09,10.93) 112.94,10.96 v1(109.08,10.96)
CB: length 1.5
  Top Layer w0.305: U1.6 14.14,27.85 C1.1
COIL1_A: length 9.3
  Bottom Layer w0.305: v1(49.98,19.46) 55.06,19.46 arc(55.22,19.49) 55.35,19.58 56.41,20.64 arc(56.54,20.73) 56.7,20.76 v1(58.78,20.76)
  vias: v1(49.16,19.43)
COIL1_B: length 9.2
  Bottom Layer w0.305: v1(58.75,18.78) 57.22,18.78 arc(57.07,18.75) 56.94,18.66 56.01,17.73 arc(55.88,17.65) 55.73,17.62 v1(49.98,17.62)
  vias: v1(49.16,17.59)
COIL2_A: length 9.3
  Bottom Layer w0.305: v1(50.01,14.25) 55.57,14.25 arc(55.72,14.22) 55.85,14.13 56.93,13.05 arc(57.06,12.96) 57.22,12.93 58.75,12.93 v1(58.75,12.93)
  vias: v1(49.18,14.22)
COIL2_B: length 9.3
  Bottom Layer w0.305: v1(58.75,11.01) 56.23,11.01 arc(56.08,11.04) 55.95,11.12 54.78,12.29 arc(54.65,12.38) 54.5,12.41 v1(50.01,12.41)
  vias: v1(49.18,12.38)
COIL3_A: length 9.3
  Bottom Layer w0.305: v1(117.93,20.64) 114.81,20.64 arc(114.65,20.61) 114.52,20.52 113.55,19.55 arc(113.42,19.46) 113.27,19.43 v1(109.08,19.43)
  vias: v1(108.26,19.41)
COIL3_B: length 9.3
  Bottom Layer w0.305: v1(109.08,17.59) 112.93,17.59 arc(113.08,17.62) 113.21,17.71 114.11,18.61 arc(114.24,18.69) 114.39,18.72 v1(117.93,18.72)
  vias: v1(108.26,17.57)
COIL4_A: length 9.4
  Bottom Layer w0.305: v1(109.11,14.18) 114.34,14.18 arc(114.5,14.15) 114.63,14.07 115.83,12.87 arc(115.96,12.78) 116.11,12.75 v1(117.93,12.75)
  vias: v1(108.28,14.16)
COIL4_B: length 9.4
  Bottom Layer w0.305: v1(117.93,10.84) 115.64,10.84 arc(115.49,10.87) 115.36,10.96 114.09,12.22 arc(113.96,12.31) 113.81,12.34 v1(109.11,12.34)
  vias: v1(108.28,12.32)
DRV_RST1: length 77.2
  Top Layer w0.203: U4.19 73.74,13 arc(73.71,12.85) 73.62,12.72 v1(73.38,12.48) ; U5.15 40.37,12.32 v1(40.38,12.33) 40.69,12.33 arc(40.85,12.3) 40.98,12.22 41.94,11.25 arc(42.03,11.12) 42.06,10.97 42.06,10.32 arc(42.09,10.17) 42.17,10.04 46.34,5.88 arc(46.47,5.79) 46.62,5.76 58.77,5.76 arc(58.92,5.73) 59.05,5.64 60.57,4.12 arc(60.7,4.04) 60.85,4.01 62.39,4.01 arc(62.55,3.98) 62.67,3.89 64.29,2.27 arc(64.42,2.19) 64.57,2.16 v1(68.56,2.16) ; v1(40.38,18.83) 38.66,18.83 U5.5 ; v1(31.03,21.26) 32.35,21.26 R7.2
  Bottom Layer w0.203: 38.81,18.83 38.81,13.2 arc(38.84,13.05) 38.92,12.92 39.39,12.45 arc(39.52,12.36) 39.67,12.33 v1(40.38,12.33) ; 38.81,18.83 38.81,19.16 38.4,19.57 arc(38.27,19.65) 38.12,19.68 33.6,19.68 arc(33.45,19.71) 33.32,19.8 31.98,21.14 arc(31.85,21.23) 31.69,21.26 v1(31.03,21.26) ; 38.81,18.83 v1(40.38,18.83) ; v1(68.56,2.16) 68.56,5.47 arc(68.59,5.62) 68.67,5.75 69.47,6.54 arc(69.6,6.63) 69.75,6.66 71.99,6.66 arc(72.15,6.63) 72.28,6.54 72.94,5.88 arc(73.07,5.79) 73.22,5.76 73.74,5.76 arc(73.9,5.79) 74.03,5.88 74.67,6.52 arc(74.75,6.65) 74.78,6.8 74.78,8.37 arc(74.75,8.52) 74.67,8.65 73.92,9.39 arc(73.8,9.48) 73.64,9.51 72.35,9.51 arc(72.2,9.54) 72.07,9.62 71.74,9.95 arc(71.65,10.08) 71.62,10.24 71.62,11.83 arc(71.65,11.98) 71.74,12.11 71.99,12.37 arc(72.12,12.45) 72.27,12.48 v1(73.38,12.48)
DRV_RST2: length 57.3
  Top Layer w0.203: U4.20 74.24,12.33 v1(74.18,12.28) ; v1(90.23,21.13) 91.62,21.13 R17.2 ; v1(82.96,7.31) 83.42,6.85 arc(83.55,6.76) 83.7,6.73 97.24,6.73 arc(97.4,6.76) 97.53,6.85 100.02,9.34 arc(100.1,9.47) 100.13,9.62 100.13,11.47 arc(100.1,11.62) 100.02,11.75 v1(99.48,12.28) U7.15 ; 99.51,18.78 U7.5
  Bottom Layer w0.203: 97.73,18.78 97.73,14.2 arc(97.76,14.05) 97.85,13.92 v1(99.48,12.28) ; 97.73,18.78 v1(99.46,18.78) ; 97.73,18.78 97.73,19.06 97.35,19.44 arc(97.22,19.53) 97.07,19.56 93.35,19.56 arc(93.2,19.59) 93.07,19.67 91.73,21.02 arc(91.6,21.1) 91.44,21.13 v1(90.23,21.13) ; v1(74.18,12.28) 74.18,10.32 arc(74.21,10.17) 74.3,10.04 76.92,7.42 arc(77.05,7.34) 77.2,7.31 v1(82.96,7.31)
FAULTN1: length 69.3
  Top Layer w0.203: U4.27 77.56,15.07 arc(77.71,15.04) 77.84,14.95 79.12,13.67 arc(79.2,13.55) 79.23,13.39 79.23,8.6 arc(79.2,8.45) 79.12,8.32 75.28,4.47 arc(75.15,4.39) 74.99,4.36 68.86,4.36 arc(68.71,4.39) 68.58,4.47 67.5,5.55 arc(67.37,5.64) 67.22,5.67 61.53,5.67 arc(61.38,5.7) 61.25,5.79 59.75,7.29 arc(59.62,7.38) 59.46,7.41 47.52,7.41 arc(47.37,7.44) 47.24,7.52 44,10.77 arc(43.91,10.9) 43.88,11.05 43.88,16.99 arc(43.85,17.15) 43.77,17.27 v1(40.91,20.13) ; R6.2 34.27,22.02 v1(34.23,22.06) ; U5.3 40.91,20.12
  Bottom Layer w0.203: v1(40.91,20.13) 35.4,20.13 arc(35.25,20.16) 35.12,20.25 34.35,21.02 arc(34.26,21.15) 34.23,21.3 v1(34.23,22.06)
FAULTN2: length 61.2
  Top Layer w0.203: v1(85.83,2.98) 86.09,3.24 arc(86.22,3.33) 86.37,3.36 86.59,3.36 arc(86.75,3.39) 86.88,3.47 87.89,4.49 arc(88.02,4.58) 88.17,4.61 97.69,4.61 arc(97.85,4.64) 97.98,4.72 101.87,8.62 arc(101.95,8.75) 101.98,8.9 101.98,17.98 arc(101.95,18.13) 101.87,18.26 100.16,19.97 arc(100.03,20.05) 99.88,20.08 U7.3 ; U4.25 76.89,13.66 arc(76.92,13.51) 77.01,13.38 v1(77.23,13.16) ; R16.2 93.2,21.33 arc(93.11,21.46) 93.08,21.61 v1(93.08,21.88)
  Bottom Layer w0.203: v1(77.23,13.16) 77.39,13 arc(77.48,12.87) 77.51,12.72 77.51,10 arc(77.54,9.85) 77.63,9.72 78.22,9.12 arc(78.35,9.04) 78.5,9.01 85.09,9.01 arc(85.25,8.98) 85.38,8.89 86.27,8 arc(86.35,7.87) 86.38,7.72 86.38,3.7 arc(86.35,3.55) 86.27,3.42 v1(85.83,2.98) ; v1(100.05,20.08) 99.95,20.18 93.95,20.18 arc(93.8,20.21) 93.67,20.3 93.2,20.77 arc(93.11,20.9) 93.08,21.05 v1(93.08,21.88)
FB12: length 7.4
  Top Layer w0.305: R1.1 11.88,23.7 arc(12,23.99) 12.28,24.1 12.55,24.1 arc(12.84,24.22) 12.95,24.5 12.95,27.45 arc(12.84,27.73) 12.55,27.85 U1.1
GATE: length 22.1
  Top Layer w0.305: 9.78,1.88 9.78,1.11 arc(9.81,0.95) 9.9,0.82 10.15,0.57 arc(10.28,0.48) 10.43,0.45 17.18,0.45 arc(17.34,0.48) 17.47,0.57 17.79,0.89 arc(17.88,1.02) 17.91,1.18 17.91,9.5 arc(17.88,9.65) 17.79,9.78 17.65,9.93 arc(17.52,10.01) 17.36,10.04 Q1.1 14.35,10.04 D2.1
HALT1: length 22
  Top Layer w0.203: U4.34 79.38,18.57 arc(79.54,18.54) 79.67,18.45 81.97,16.15 arc(82.05,16.02) 82.08,15.87 82.08,6.21 arc(82.05,6.06) 81.97,5.93 79.6,3.56 arc(79.51,3.43) 79.48,3.28 79.48,1.23
HALT2: length 21.2
  Top Layer w0.203: U4.33 79.18,18.07 arc(79.33,18.04) 79.46,17.95 81.47,15.94 arc(81.55,15.81) 81.58,15.66 81.58,6.42 arc(81.55,6.27) 81.47,6.14 79.1,3.77 arc(79.01,3.64) 78.98,3.49 78.98,1.23
HALT3: length 20.4
  Top Layer w0.203: 78.48,1.23 78.48,3.7 arc(78.51,3.85) 78.6,3.98 80.97,6.34 arc(81.05,6.47) 81.08,6.63 81.08,15.45 arc(81.05,15.61) 80.97,15.74 79.25,17.45 arc(79.12,17.54) 78.97,17.57 U4.32
HALT4: length 19.6
  Top Layer w0.203: 77.98,1.23 77.98,3.9 arc(78.01,4.06) 78.1,4.19 80.47,6.55 arc(80.55,6.68) 80.58,6.83 80.58,15.25 arc(80.55,15.4) 80.47,15.53 79.04,16.95 arc(78.91,17.04) 78.76,17.07 U4.31
HALT5: length 18.7
  Top Layer w0.203: U4.30 78.55,16.57 arc(78.71,16.54) 78.84,16.45 79.97,15.32 arc(80.05,15.19) 80.08,15.04 80.08,7.04 arc(80.05,6.89) 79.97,6.76 77.6,4.39 arc(77.51,4.26) 77.48,4.11 77.48,1.23
MID: length 2.2
  Top Layer w0.305: D1.2 7.62,8.4 D3.2
OC_AJ1: length 5.1
  Top Layer w0.305: U5.7 36.48,17.52 arc(36.33,17.55) 36.2,17.64 34.4,19.44 R8.2
OC_AJ2: length 5
  Top Layer w0.305: R18.2 93.47,19.27 95.14,17.6 arc(95.27,17.51) 95.42,17.48 U7.7
OTWN1: length 63.5
  Top Layer w0.203: U5.2 41.09,20.77 arc(41.25,20.74) 41.38,20.66 44.24,17.79 arc(44.33,17.66) 44.36,17.51 44.36,11.2 arc(44.39,11.05) 44.48,10.92 47.49,7.9 arc(47.62,7.81) 47.77,7.78 59.62,7.78 arc(59.77,7.75) 59.9,7.67 61.4,6.16 arc(61.53,6.08) 61.69,6.05 67.53,6.05 arc(67.68,6.02) 67.81,5.93 68.84,4.9 arc(68.97,4.81) 69.12,4.78 74.89,4.78 arc(75.05,4.81) 75.17,4.9 78.42,8.14 arc(78.5,8.27) 78.53,8.42 v1(78.53,10.78) ; U4.28 77.98,15.57 arc(78.14,15.54) 78.27,15.45 v1(78.51,15.21)
  Top Layer w0.305: R5.2 36.13,19.53 37.26,20.66 arc(37.39,20.74) 37.54,20.77 U5.2
  Bottom Layer w0.203: v1(78.53,10.78) 78.53,15.18 v1(78.51,15.21)
OTWN2: length 59.5
  Top Layer w0.203: v1(86.16,2.03) 86.28,2.03 88.34,4.09 arc(88.47,4.18) 88.62,4.21 98.12,4.21 arc(98.27,4.24) 98.4,4.33 102.32,8.24 arc(102.4,8.37) 102.43,8.52 102.43,18.45 arc(102.4,18.6) 102.32,18.73 100.43,20.62 arc(100.3,20.7) 100.15,20.73 U7.2 ; U4.26 77.51,14.57 arc(77.66,14.54) 77.79,14.45 77.82,14.42 arc(77.9,14.3) 77.93,14.14 v1(77.93,13.81)
  Top Layer w0.305: 95.27,19.18 95.27,19.42 96.46,20.62 arc(96.59,20.7) 96.74,20.73 U7.2
  Bottom Layer w0.203: v1(86.16,2.03) 86.82,2.69 arc(86.9,2.82) 86.93,2.97 86.93,8.19 arc(86.9,8.34) 86.82,8.47 85.95,9.34 arc(85.82,9.43) 85.66,9.46 78.72,9.46 arc(78.57,9.49) 78.44,9.58 78.09,9.92 arc(78.01,10.05) 77.97,10.21 77.97,13.77 v1(77.93,13.81)
PWM1A: length 51.5
  Top Layer w0.203: U4.9 69.56,15.57 arc(69.41,15.6) 69.28,15.68 69.28,15.69 arc(69.15,15.77) 69,15.8 v1(68.65,15.8) ; U5.4 40.56,19.47 arc(40.71,19.44) 40.84,19.36 43.33,16.87 arc(43.41,16.74) 43.44,16.58 43.44,10.84 arc(43.47,10.68) 43.56,10.55 47.02,7.1 arc(47.15,7.01) 47.3,6.98 59.29,6.98 arc(59.44,6.95) 59.57,6.87 61.07,5.36 arc(61.2,5.28) 61.36,5.25 64.08,5.25 arc(64.23,5.22) 64.36,5.13 v1(65.38,4.11)
  Bottom Layer w0.203: v1(68.65,15.8) 68.05,15.8 arc(67.89,15.77) 67.76,15.69 65.7,13.62 arc(65.61,13.49) 65.58,13.34 65.58,5.4 65.38,5.2 v1(65.38,4.11)
PWM1B: length 51.4
  Top Layer w0.203: v1(66.11,3.43) 65.05,3.43 arc(64.9,3.46) 64.77,3.55 63.54,4.78 arc(63.41,4.87) 63.25,4.9 61.21,4.9 arc(61.06,4.93) 60.93,5.01 59.43,6.52 arc(59.3,6.6) 59.14,6.63 47,6.63 arc(46.85,6.66) 46.72,6.75 43.15,10.32 arc(43.06,10.45) 43.03,10.6 43.03,16.24 arc(43,16.4) 42.92,16.52 41.38,18.06 arc(41.25,18.14) 41.1,18.17 U5.6 ; U4.10 68.03,15.07 v1(68.03,15.07)
  Bottom Layer w0.203: v1(66.11,3.43) 66.11,12.99 arc(66.14,13.14) 66.23,13.27 v1(68.03,15.07)
PWM2A: length 47.2
  Top Layer w0.203: U4.11 69.34,14.57 69.21,14.44 v1(68.69,14.44) ; v1(66.81,2.81) 64.65,2.81 arc(64.5,2.84) 64.37,2.92 62.94,4.35 arc(62.81,4.44) 62.65,4.47 61.04,4.47 arc(60.88,4.5) 60.75,4.59 59.25,6.09 arc(59.12,6.18) 58.97,6.21 46.8,6.21 arc(46.65,6.24) 46.52,6.33 42.65,10.19 arc(42.56,10.32) 42.53,10.47 42.53,11.19 arc(42.5,11.35) 42.42,11.47 41.03,12.86 arc(40.9,12.94) 40.75,12.97 U5.14
  Bottom Layer w0.203: v1(68.69,14.44) 68.24,14.44 arc(68.09,14.41) 67.96,14.32 66.67,13.04 arc(66.59,12.91) 66.56,12.75 66.56,4.37 arc(66.59,4.22) 66.67,4.09 66.69,4.08 arc(66.78,3.95) 66.81,3.79 v1(66.81,2.81)
PWM2B: length 48.3
  Top Layer w0.203: U5.16 40.73,11.67 arc(40.88,11.64) 41.01,11.56 41.54,11.02 arc(41.63,10.9) 41.66,10.74 41.66,10 arc(41.69,9.85) 41.78,9.72 46.04,5.45 arc(46.17,5.36) 46.32,5.33 58.61,5.33 arc(58.76,5.3) 58.89,5.22 60.39,3.71 arc(60.52,3.63) 60.67,3.6 62.08,3.6 arc(62.23,3.57) 62.36,3.48 64.21,1.63 arc(64.34,1.55) 64.49,1.51 v1(67.38,1.51) ; v1(68.1,13.67) 68.83,13.67 arc(68.99,13.71) 69.12,13.79 69.28,13.95 arc(69.41,14.04) 69.56,14.07 U4.12
  Bottom Layer w0.203: v1(68.1,13.67) 67.1,12.67 arc(67.01,12.54) 66.98,12.39 66.98,4.73 arc(67.01,4.58) 67.1,4.45 67.27,4.29 arc(67.35,4.16) 67.38,4 v1(67.38,1.51)
PWM3A: length 55.9
  Top Layer w0.203: v1(84.33,2.46) 86.79,4.92 arc(86.92,5) 87.07,5.03 97.34,5.03 arc(97.5,5.06) 97.63,5.15 101.44,8.97 arc(101.53,9.1) 101.56,9.25 101.56,17.48 arc(101.53,17.64) 101.44,17.77 99.89,19.32 arc(99.76,19.4) 99.61,19.43 U7.4 ; v1(70.6,5.53) 70.6,6.09 70.74,6.22 U4.13
  Bottom Layer w0.203: v1(84.33,2.46) 75.02,2.46 arc(74.87,2.49) 74.74,2.58 72.6,4.72 arc(72.47,4.8) 72.32,4.83 71.44,4.83 arc(71.29,4.86) 71.16,4.95 70.81,5.3 70.81,5.33 v1(70.6,5.53)
PWM3B: length 52.4
  Top Layer w0.203: U7.6 99.07,18.13 arc(99.23,18.1) 99.36,18.02 100.99,16.38 arc(101.08,16.25) 101.11,16.1 101.11,9.42 arc(101.08,9.27) 100.99,9.14 97.42,5.58 arc(97.3,5.49) 97.14,5.46 86.57,5.46 arc(86.42,5.43) 86.29,5.34 84.08,3.13 arc(83.95,3.05) 83.8,3.02 v1(83.32,3.02) ; U4.14 71.24,6.22 71.37,6.09 v1(71.37,5.53)
  Bottom Layer w0.203: v1(83.32,3.02) 83.26,2.96 75.05,2.96 arc(74.9,2.99) 74.77,3.08 72.42,5.42 arc(72.3,5.5) 72.14,5.53 v1(71.37,5.53)
PWM4A: length 37.1
  Top Layer w0.203: v1(76.93,11.98) 76.35,12.56 arc(76.27,12.69) 76.24,12.85 U4.24 ; U7.14 97.73,12.91 99.51,12.91 arc(99.67,12.88) 99.8,12.8 100.54,12.05 arc(100.63,11.92) 100.66,11.77 100.66,9.52 arc(100.63,9.37) 100.54,9.24 97.59,6.29 arc(97.46,6.21) 97.31,6.17 v1(85.58,6.17)
  Bottom Layer w0.203: v1(85.58,6.17) 85.58,7.52 arc(85.55,7.67) 85.47,7.8 84.85,8.42 arc(84.72,8.5) 84.57,8.53 78.35,8.53 arc(78.2,8.56) 78.07,8.65 77.05,9.67 arc(76.96,9.8) 76.93,9.95 v1(76.93,11.98)
PWM4B: length 32.9
  Top Layer w0.203: v1(77.38,8.53) 76.36,9.56 arc(76.27,9.69) 76.24,9.84 76.24,11.74 76.23,11.75 76.23,12.01 75.85,12.39 arc(75.77,12.52) 75.74,12.67 U4.23 ; v1(84.13,7.68) 84.52,7.3 arc(84.65,7.21) 84.8,7.18 97.07,7.18 arc(97.22,7.21) 97.35,7.3 99.49,9.44 arc(99.58,9.57) 99.61,9.72 99.61,11.1 arc(99.58,11.25) 99.49,11.38 99.36,11.52 arc(99.23,11.6) 99.07,11.63 U7.16
  Bottom Layer w0.203: v1(77.38,8.53) 77.74,8.17 arc(77.87,8.09) 78.02,8.06 83.59,8.06 arc(83.75,8.03) 83.88,7.94 v1(84.13,7.68)
RESET_SWD: length 13.8
  Top Layer w0.203: U4.40 74.74,20.77 arc(74.77,20.92) 74.85,21.05 75.58,21.77 arc(75.66,21.9) 75.69,22.06 R4.1 75.71,22.45 v1(75.71,23.18) ; FPC1.5 v1(70.68,24.82)
  Bottom Layer w0.203: v1(75.71,23.18) 74.19,24.7 arc(74.06,24.79) 73.91,24.82 v1(70.68,24.82)
RS485_A: length 85.2
  Top Layer w0.3: R13.1 64.19,14.1 arc(64.28,13.97) 64.31,13.82 64.31,12.75 arc(64.28,12.6) 64.19,12.47 63.41,11.69 arc(63.28,11.6) 63.13,11.57 61.2,11.57 v1(61.16,11.61)
  PWR (20VB/12VB) w0.3: v1(61.16,11.61) 61.55,11.61 arc(61.7,11.64) 61.83,11.72 63.34,13.23 arc(63.43,13.36) 63.46,13.51 63.46,20.84 arc(63.43,21) 63.34,21.12 58.78,25.69 arc(58.65,25.78) 58.49,25.81 22.87,25.81 arc(22.72,25.78) 22.59,25.69 18.68,21.77 arc(18.59,21.65) 18.56,21.49 18.56,20.55 arc(18.53,20.4) 18.44,20.27 15.94,17.77 arc(15.81,17.68) 15.66,17.65 7.38,17.65 arc(7.23,17.68) 7.1,17.77 5.15,19.72 arc(5.02,19.8) 4.87,19.83 3.75,19.83 arc(3.59,19.8) 3.46,19.72 3.45,19.71 arc(3.32,19.62) 3.17,19.59 NOREF#5.2
RS485_B: length 96
  Top Layer w0.3: R13.2 65.48,14.5 arc(65.39,14.37) 65.36,14.22 65.36,11.67 arc(65.33,11.52) 65.24,11.39 64.27,10.42 arc(64.14,10.33) 63.98,10.3 v1(61.13,10.3)
  PWR (20VB/12VB) w0.3: v1(61.13,10.3) 62.09,10.3 arc(62.25,10.33) 62.38,10.42 64.65,12.69 arc(64.74,12.82) 64.77,12.97 64.77,21.38 arc(64.74,21.54) 64.65,21.67 59.32,27 arc(59.19,27.09) 59.03,27.12 22.33,27.12 arc(22.18,27.09) 22.05,27 17.37,22.32 arc(17.28,22.19) 17.25,22.03 17.25,21.09 arc(17.22,20.94) 17.13,20.81 15.4,19.08 arc(15.27,18.99) 15.12,18.96 7.92,18.96 arc(7.77,18.99) 7.64,19.08 4.43,22.28 arc(4.35,22.41) 4.32,22.57 4.32,25.79 arc(4.28,25.94) 4.2,26.07 3.45,26.82 arc(3.32,26.91) 3.17,26.94 NOREF#2.1
RS485_DE: length 11.7
  Top Layer w0.203: U4.21 74.74,12.75 arc(74.77,12.59) 74.85,12.46 v1(75.07,12.25)
  Top Layer w0.3: v1(68.96,11.61) 69.03,11.68 R14.2 ; U6.3 69.74,11.57
  Bottom Layer w0.203: v1(68.96,11.61) 69.94,11.61 arc(70.1,11.64) 70.23,11.72 71.87,13.37 arc(72,13.45) 72.15,13.48 74.24,13.48 arc(74.4,13.45) 74.53,13.37 74.95,12.94 arc(75.04,12.81) 75.07,12.66 v1(75.07,12.25)
RS485_RX: length 12.4
  Top Layer w0.203: U6.1 68.01,8.88 v1(68.01,8.21) ; U4.16 72.24,8.77 arc(72.27,8.62) 72.35,8.49 72.52,8.33 arc(72.65,8.24) 72.8,8.21 v1(73.43,8.21)
  Bottom Layer w0.203: v1(73.43,8.21) v1(68.01,8.21)
RS485_TX: length 22.5
  Top Layer w0.203: U4.15 71.74,8.65 arc(71.77,8.49) 71.85,8.36 v1(73.58,6.63) ; v1(69.43,12.83) 67.86,12.83 U6.4
  Bottom Layer w0.203: v1(73.58,6.63) 74.04,7.09 arc(74.13,7.22) 74.16,7.37 74.16,8.37 arc(74.13,8.52) 74.04,8.65 73.83,8.87 arc(73.7,8.95) 73.54,8.98 68.4,8.98 arc(68.25,9.01) 68.12,9.1 67.9,9.32 arc(67.81,9.45) 67.78,9.6 67.78,11.99 arc(67.81,12.14) 67.9,12.27 68.35,12.72 arc(68.48,12.8) 68.63,12.83 v1(69.43,12.83)
SUB: length 10.5
  Top Layer w0.305: D3.1 7.58,11.67 arc(7.61,11.52) 7.7,11.39 8.16,10.92 arc(8.29,10.84) 8.44,10.81 10.24,10.81 arc(10.39,10.78) 10.52,10.69 10.81,10.4 arc(10.89,10.27) 10.92,10.12 10.92,9.03 10.8,8.9 11.67,8.9 arc(11.95,8.78) 12.07,8.5 12.07,6.78 U2.6
SW12: length 8
  Top Layer w0.305: C1.2 13.3,29.97 arc(13.41,30.25) 13.7,30.36 15.22,30.36 arc(15.5,30.25) 15.62,29.97 15.62,27.3 arc(15.5,27.02) 15.22,26.9 U1.5
SWDCLK: length 9.5
  Top Layer w0.203: FPC1.4 69.93,24.32 arc(70.09,24.29) 70.22,24.2 70.64,23.77 arc(70.73,23.65) 70.76,23.49 70.76,21.93 arc(70.79,21.78) 70.88,21.65 71.11,21.41 arc(71.24,21.33) 71.39,21.29 71.79,21.29 arc(71.95,21.26) 72.08,21.18 72.12,21.14 arc(72.21,21.01) 72.24,20.85 U4.45
SWDIO: length 8.5
  Top Layer w0.203: U4.46 71.74,20.81 71.56,20.99 71.27,20.99 arc(71.12,21.02) 70.99,21.11 70.55,21.54 arc(70.46,21.67) 70.43,21.83 70.43,23.11 arc(70.4,23.26) 70.32,23.39 70.01,23.7 arc(69.88,23.79) 69.73,23.82 FPC1.3
TEMP_1W: length 17.9
  Top Layer w0.203: 76.98,1.23 76.98,4.32 arc(77.01,4.47) 77.1,4.6 79.47,6.97 arc(79.55,7.1) 79.58,7.25 79.58,14.83 arc(79.55,14.98) 79.47,15.11 78.63,15.95 arc(78.5,16.04) 78.35,16.07 U4.29
VCORE: length 2.3
  Top Layer w0.3: U4.43 73.24,21.46 arc(73.27,21.61) 73.35,21.74 C65.2
VREG1: length 3
  Top Layer w0.305: U5.10 36.2,15.57 C29.1
VREG2: length 2.7
  Top Layer w0.305: U7.10 96.05,15.53 arc(95.9,15.5) 95.77,15.42 C53.1

## Copper pours and planes (outline as drawn; the poured copper is in the pictures)
+12VB on Top Layer: 8.51,19.06 23.24,19.06 23.24,15.12 8.51,15.12
+12VB on Top Layer: 31.72,11.85 39.97,11.85 39.97,9.93 31.72,9.93
+12VB on Top Layer: 90.87,11.83 98.86,11.83 98.86,9.91 90.87,9.91
+52V on Top Layer: 0.25,14.24 17.15,14.24 17.15,0.14 0.25,0.14
+52VB on Top Layer: 6.73,31 113.98,31 113.98,0.27 6.73,0.27
GND on Top Layer: 48.53,21.28 57.11,21.28 57.11,10.66 48.53,10.66
GND on Top Layer: 107.63,21.17 116.14,21.17 116.14,10.54 107.63,10.54
GND on Top Layer: -5.84,48.13 133.86,48.13 133.86,-3.94 -5.84,-3.94
GND on Bottom Layer: -17.02,39.89 128.52,39.89 128.52,-22.47 -17.02,-22.47
GND on GND1: 0.26,30.74 120.74,30.74 120.74,0.26 0.26,0.26
GND on PWR (20VB/12VB): -8.38,40.65 146.69,40.65 146.69,-20.31 -8.38,-20.31
GND on In4.Cu: 0.26,30.74 120.74,30.74 120.74,0.26 0.26,0.26
COIL1_A on Top Layer: 48.53,19.78 53.08,19.78 53.08,19.08 48.53,19.08
COIL1_A on Bottom Layer: 33.16,20.11 50.51,20.11 50.51,0.66 33.16,0.66
COIL1_B on Top Layer: 48.53,17.94 53.08,17.94 53.08,17.24 48.53,17.24
COIL1_B on Bottom Layer: 39.63,17.96 50.51,17.96 50.51,0.66 39.63,0.66
COIL2_A on Top Layer: 48.56,14.58 53.03,14.58 53.03,13.88 48.56,13.88
COIL2_A on Bottom Layer: 46.38,14.86 53.61,14.86 53.61,0.63 46.38,0.63
COIL2_B on Top Layer: 48.56,12.73 53.11,12.73 53.11,12.03 48.56,12.03
COIL2_B on Bottom Layer: 48.06,12.77 60.96,12.77 60.96,0.63 48.06,0.63
COIL3_A on Top Layer: 107.63,19.73 112.18,19.73 112.18,19.06 107.63,19.06
COIL3_A on Bottom Layer: 92.23,20.08 109.58,20.08 109.58,0.63 92.23,0.63
COIL3_B on Top Layer: 107.63,17.92 112.18,17.92 112.18,17.22 107.63,17.22
COIL3_B on Bottom Layer: 98.73,17.93 109.61,17.93 109.61,0.63 98.73,0.63
COIL4_A on Top Layer: 107.66,14.51 112.21,14.51 112.21,13.81 107.66,13.81
COIL4_A on Bottom Layer: 105.48,14.83 112.71,14.83 112.71,0.61 105.48,0.61
COIL4_B on Top Layer: 107.66,12.67 112.21,12.67 112.21,11.97 107.66,11.97
COIL4_B on Bottom Layer: 107.16,12.75 120.06,12.75 120.06,0.61 107.16,0.61
SW12 on Top Layer: 13.58,28.21 23.37,28.21 23.37,26.68 13.58,26.68

Small or netless copper shapes (teardrops, artwork), in the pictures only: 190 on Top Layer, 82 on Bottom Layer, 4 on GND1, 24 on PWR (20VB/12VB), 12 on In4.Cu

## Text on the board
Top Silkscreen Layer: RSB | RSA | 52V | GND | C1A | C1B | C2A | C2B | C3A | C3B | C4A | C4B
